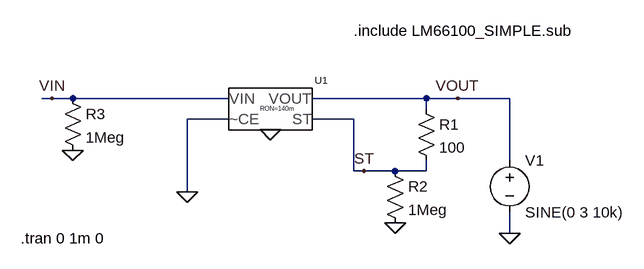
[diagram p0: schematic ideal-diode-test.asc]
ideal-diode-test.asc, the LTspice schematic file:
Version 4.1
SHEET 1 880 680
WIRE -192 144 -208 144
WIRE -160 144 -192 144
WIRE 80 144 -160 144
WIRE 384 144 208 144
WIRE 432 144 384 144
WIRE 512 144 432 144
WIRE 384 160 384 144
WIRE 80 176 16 176
WIRE 272 176 208 176
WIRE 512 240 512 144
WIRE 272 256 272 176
WIRE 288 256 272 256
WIRE 336 256 288 256
WIRE 384 256 384 240
WIRE 384 256 336 256
WIRE 16 288 16 176
WIRE 512 352 512 320
FLAG 512 352 0
FLAG 288 256 ST
FLAG 432 144 VOUT
FLAG 144 192 0
FLAG 336 336 0
FLAG 16 288 0
FLAG -192 144 VIN
FLAG -160 224 0
SYMBOL voltage 512 224 R0
WINDOW 123 0 0 Left 0
WINDOW 39 0 0 Left 0
SYMATTR InstName V1
SYMATTR Value SINE(0 3 10k)
SYMBOL res 368 144 R0
SYMATTR InstName R1
SYMATTR Value 100
SYMBOL custom\\LM66100\\LM66100_SIMPLE 128 160 R0
WINDOW 39 0 0 Left 0
SYMATTR SpiceLine RON=140m
SYMATTR InstName U1
SYMBOL res 320 240 R0
SYMATTR InstName R2
SYMATTR Value 1Meg
SYMBOL res -176 128 R0
SYMATTR InstName R3
SYMATTR Value 1Meg
TEXT -240 360 Left 2 !.tran 0 1m 0
TEXT 272 40 Left 2 !.include LM66100_SIMPLE.sub

The netlist it stands for:
* ideal-diode-test.asc
V1 VOUT 0 SINE(0 3 10k)
R1 VOUT ST 100
X§U1 VIN VOUT 0 ST 0 LM66100_SIMPLE params: RON=140m  ; pins VIN VOUT CE ST G
R2 ST 0 1Meg
R3 VIN 0 1Meg
.tran 0 1m 0
.include LM66100_SIMPLE.sub
.backanno
.end